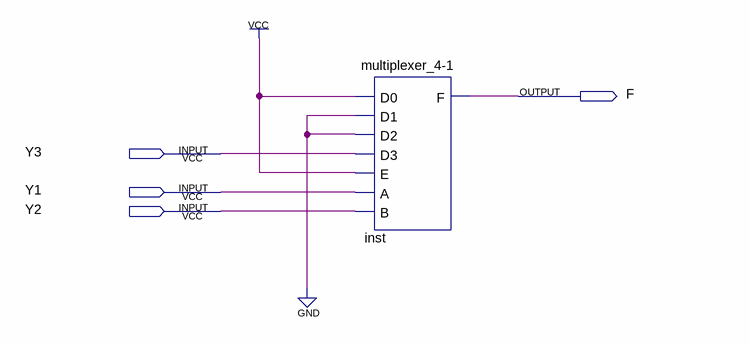
[diagram p0: schematic sheet]
// Quartus schematic Y1to3.bdf as structural Verilog: 1 symbols, 4 pins
module Y1to3 (
  input  Y3,
  input  Y1,
  input  Y2,
  output F
);

  \multiplexer_4-1  inst (.D0(1'b1), .D1(1'b0), .D2(1'b0), .D3(Y3), .E(1'b1), .A(Y1), .B(Y2), .F(F));
endmodule
